# Altium schematic sheet power_protection.SchDoc
size 297 x 209 mm
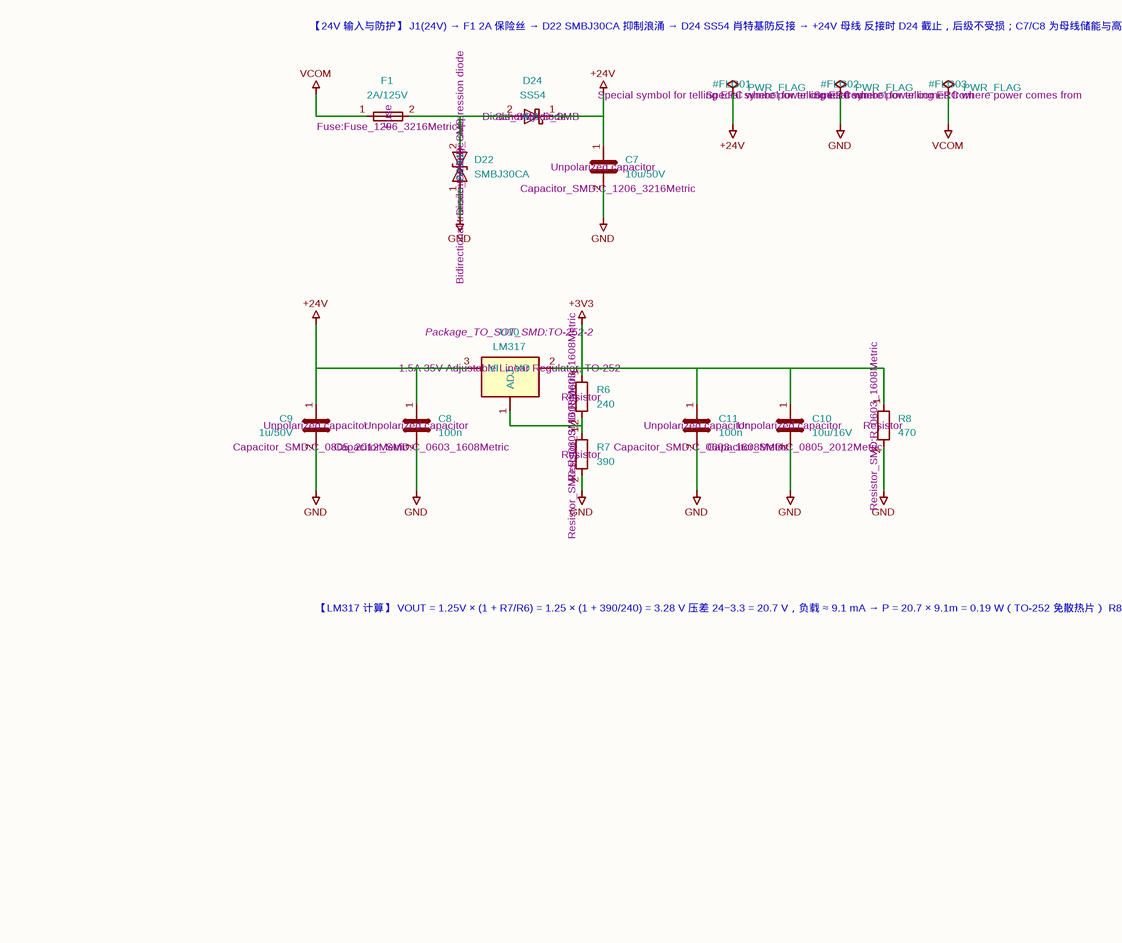
[diagram p0: power_protection.SchDoc]

## Parts
#FLG01  Description: Special symbol for telling ERC where power comes from  (hidden comment: PWR_FLAG)  (graphical)
#FLG02  Description: Special symbol for telling ERC where power comes from  (hidden comment: PWR_FLAG)  (graphical)
#FLG03  Description: Special symbol for telling ERC where power comes from  (hidden comment: PWR_FLAG)  (graphical)
C7  Description: Unpolarized capacitor  Footprint: Capacitor_SMD:C_1206_3216Metric  [C_1206_3216Metric]  (hidden comment: 10u/50V)
C8  Description: Unpolarized capacitor  Footprint: Capacitor_SMD:C_0603_1608Metric  [C_0603_1608Metric]  (hidden comment: 100n)
C9  Description: Unpolarized capacitor  Footprint: Capacitor_SMD:C_0805_2012Metric  [C_0805_2012Metric]  (hidden comment: 1u/50V)
C10  Description: Unpolarized capacitor  Footprint: Capacitor_SMD:C_0805_2012Metric  [C_0805_2012Metric]  (hidden comment: 10u/16V)
C11  Description: Unpolarized capacitor  Footprint: Capacitor_SMD:C_0603_1608Metric  [C_0603_1608Metric]  (hidden comment: 100n)
D22  Description: Bidirectional transient-voltage-suppression diode  Footprint: Diode_SMD:D_SMB  [D_SMB]  (hidden comment: SMBJ30CA)
D24  Description: Schottky diode  Footprint: Diode_SMD:D_SMB  [D_SMB]  (hidden comment: SS54)
F1  Footprint: Fuse:Fuse_1206_3216Metric  [Fuse_1206_3216Metric]  (hidden comment: 2A/125V)
R6  Description: Resistor  Footprint: Resistor_SMD:R_0603_1608Metric  [R_0603_1608Metric]  (hidden comment: 240)
R7  Description: Resistor  Footprint: Resistor_SMD:R_0603_1608Metric  [R_0603_1608Metric]  (hidden comment: 390)
R8  Description: Resistor  Footprint: Resistor_SMD:R_0603_1608Metric  [R_0603_1608Metric]  (hidden comment: 470)
U10  Description: 1.5A 35V Adjustable Linear Regulator, TO-252  Footprint: Package_TO_SOT_SMD:TO-252-2  [TO-252-2]  (hidden comment: LM317)

## Nets
+3V3: C10.1 C11.1 R6.1 R8.1 U10.2(VO)
+24V: #FLG01.1 C7.1 C8.1 C9.1 D24.1(K) U10.3(VI)
GND: #FLG02.1 C7.2 C8.2 C9.2 C10.2 C11.2 D22.1(A1) R7.2 R8.2
VCOM: #FLG03.1 F1.1
NetD22_2: D22.2(A2) D24.2(A) F1.2
NetR6_2: R6.2 R7.1 U10.1(ADJ)

## Notes on the sheet
- 【24V 输入与防护】
  J1(24V) → F1 2A 保险丝 → D22 SMBJ30CA 抑制浪涌 → D24 SS54 肖特基防反接 → +24V 母线
  反接时 D24 截止，后级不受损；C7/C8 为母线储能与高频旁路
  保险丝：4×333 mA = 1.33 A ⇒ 2A；TVS：SMBJ30CA 关断 30 V > 24×1.1 = 26.4 V，峰值钳位 48.4 V
- 【LM317 计算】
  VOUT = 1.25V × (1 + R7/R6) = 1.25 × (1 + 390/240) = 3.28 V
  压差 24−3.3 = 20.7 V，负载 ≈ 9.1 mA → P = 20.7 × 9.1m = 0.19 W（TO-252 免散热片）
  R8 = 470Ω 预负载（7 mA），保证 LM317 轻载稳压；C9 输处、C10/C11 输出
- 1
- 2
- 3
- 4
- 5
- 6
- A
- B
- C
- 输入：24V DC（2A 保险丝 + SMBJ30CA + SS54 防反接）
- 3V3：LM317 线性稳压（模拟电源用线性，避免开关噪声进入 DAC/ADC）
- D
- Title: 电源与防护 — 24V 输入 / 3V3
- File: power_protection.kicad_sch
- Sheet: /
- integrating_box_light_source
- KiCad E.D.A.  kicad (5.1.4)-1
- Size: A4
- Date: 2026-11-08
- Rev: A
- Id: 1/1

## Library data of the parts
C7-C11 = C
  C7: Value: 10u/50V
  C8 C11: Value: 100n
  C9: Value: 1u/50V
  C10: Value: 10u/16V
D22 = D_TVS: Value: SMBJ30CA
D24 = D_Schottky: Value: SS54
F1 = Fuse: Description: Fuse; Value: 2A/125V
R6-R8 = R
  R6: Value: 240
  R7: Value: 390
  R8: Value: 470
U10 = LM317_TO-252: Value: LM317
#FLG01 #FLG02 #FLG03 = PWR_FLAG: Value: PWR_FLAG